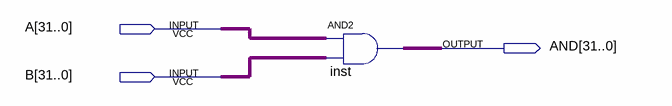
[diagram p0: schematic sheet]
// Quartus schematic And_32bit.bdf as structural Verilog: 1 symbols, 3 pins
module And_32bit (
  input  [31:0] A,
  input  [31:0] B,
  output [31:0] AND
);

  assign AND = A & B;  // AND2 inst, 32 bits wide
endmodule
